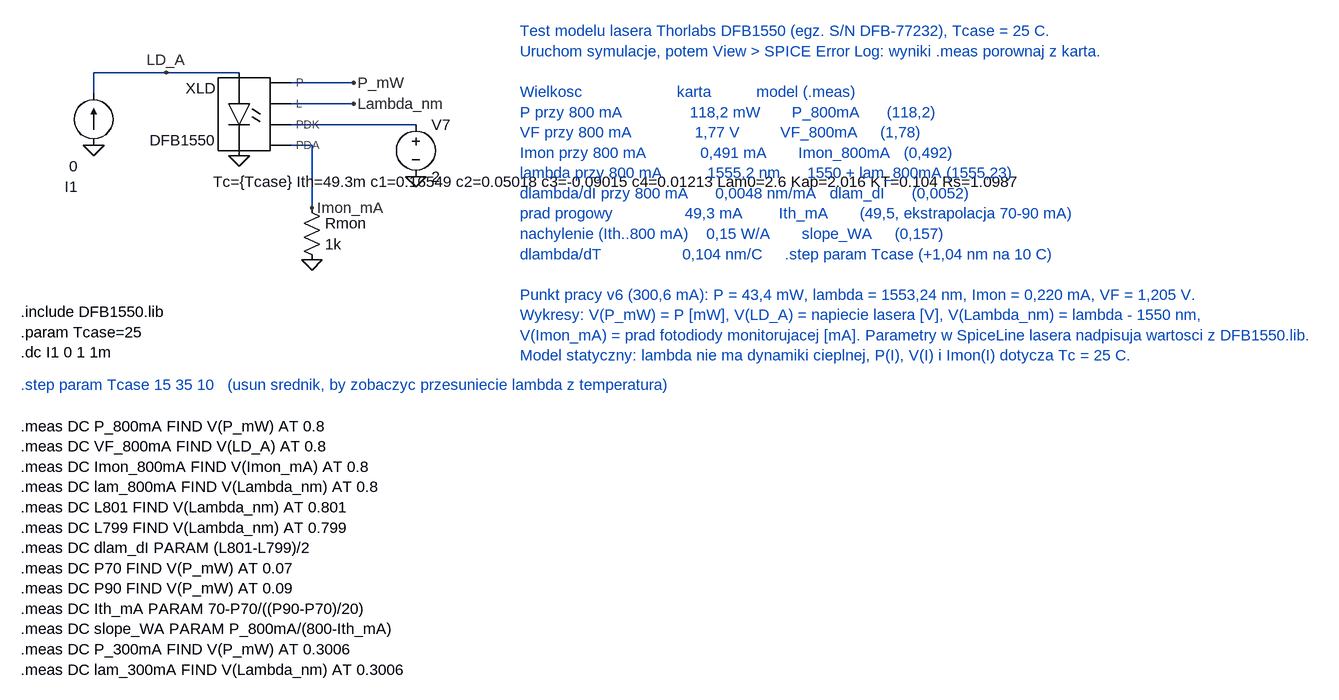
[diagram p0: schematic DFB1550_test.asc]
DFB1550_test.asc, the LTspice schematic file:
Version 4
SHEET 1 1600 1100
WIRE 176 192 176 160
WIRE 176 160 400 160
WIRE 480 176 576 176
WIRE 480 208 576 208
WIRE 480 240 672 240
WIRE 480 272 512 272
WIRE 512 272 512 368
FLAG 176 272 0
FLAG 288 160 LD_A
FLAG 400 288 0
FLAG 576 176 P_mW
FLAG 576 208 Lambda_nm
FLAG 672 320 0
FLAG 512 448 0
FLAG 512 368 Imon_mA
SYMBOL current 176 272 R180
WINDOW 0 24 -64 Left 2
WINDOW 3 24 -32 Left 2
SYMATTR InstName I1
SYMATTR Value 0
SYMBOL DFB1550 400 160 R0
WINDOW 0 -36 24 Right 2
WINDOW 3 -36 104 Right 2
WINDOW 39 -40 168 Left 2
SYMATTR InstName XLD
SYMATTR Value DFB1550
SYMATTR SpiceLine Tc={Tcase} Ith=49.3m c1=0.16549 c2=0.05018 c3=-0.09015 c4=0.01213 Lam0=2.6 Kap=2.016 KT=0.104 Rs=1.0987
SYMBOL voltage 672 224 R0
WINDOW 0 24 16 Left 2
WINDOW 3 24 96 Left 2
SYMATTR InstName V7
SYMATTR Value 2
SYMBOL res 496 352 R0
WINDOW 0 36 40 Left 2
WINDOW 3 36 72 Left 2
SYMATTR InstName Rmon
SYMATTR Value 1k
TEXT 64 528 Left 2 !.include DFB1550.lib\n.param Tcase=25\n.dc I1 0 1 1m
TEXT 64 640 Left 2 ;.step param Tcase 15 35 10   (usun srednik, by zobaczyc przesuniecie lambda z temperatura)
TEXT 64 704 Left 2 !.meas DC P_800mA FIND V(P_mW) AT 0.8\n.meas DC VF_800mA FIND V(LD_A) AT 0.8\n.meas DC Imon_800mA FIND V(Imon_mA) AT 0.8\n.meas DC lam_800mA FIND V(Lambda_nm) AT 0.8\n.meas DC L801 FIND V(Lambda_nm) AT 0.801\n.meas DC L799 FIND V(Lambda_nm) AT 0.799\n.meas DC dlam_dI PARAM (L801-L799)/2\n.meas DC P70 FIND V(P_mW) AT 0.07\n.meas DC P90 FIND V(P_mW) AT 0.09\n.meas DC Ith_mA PARAM 70-P70/((P90-P70)/20)\n.meas DC slope_WA PARAM P_800mA/(800-Ith_mA)\n.meas DC P_300mA FIND V(P_mW) AT 0.3006\n.meas DC lam_300mA FIND V(Lambda_nm) AT 0.3006
TEXT 832 96 Left 2 ;Test modelu lasera Thorlabs DFB1550 (egz. S/N DFB-77232), Tcase = 25 C.\nUruchom symulacje, potem View > SPICE Error Log: wyniki .meas porownaj z karta.\n\nWielkosc                     karta          model (.meas)\nP przy 800 mA               118,2 mW       P_800mA      (118,2)\nVF przy 800 mA              1,77 V         VF_800mA     (1,78)\nImon przy 800 mA            0,491 mA       Imon_800mA   (0,492)\nlambda przy 800 mA          1555,2 nm      1550 + lam_800mA (1555,23)\ndlambda/dI przy 800 mA      0,0048 nm/mA   dlam_dI      (0,0052)\nprad progowy                49,3 mA        Ith_mA       (49,5, ekstrapolacja 70-90 mA)\nnachylenie (Ith..800 mA)    0,15 W/A       slope_WA     (0,157)\ndlambda/dT                  0,104 nm/C     .step param Tcase (+1,04 nm na 10 C)\n\nPunkt pracy v6 (300,6 mA): P = 43,4 mW, lambda = 1553,24 nm, Imon = 0,220 mA, VF = 1,205 V.\nWykresy: V(P_mW) = P [mW], V(LD_A) = napiecie lasera [V], V(Lambda_nm) = lambda - 1550 nm,\nV(Imon_mA) = prad fotodiody monitorujacej [mA]. Parametry w SpiceLine lasera nadpisuja wartosci z DFB1550.lib.\nModel statyczny: lambda nie ma dynamiki cieplnej, P(I), V(I) i Imon(I) dotycza Tc = 25 C.

The netlist it stands for:
* DFB1550_test.asc
I1 0 LD_A 0
XXLD LD_A 0 P_mW Lambda_nm N001 Imon_mA DFB1550 Tc={Tcase} Ith=49.3m c1=0.16549 c2=0.05018 c3=-0.09015 c4=0.01213 Lam0=2.6 Kap=2.016 KT=0.104 Rs=1.0987  ; pins A K P L PDK PDA
V7 N001 0 2
Rmon Imon_mA 0 1k
.include DFB1550.lib
.param Tcase=25
.dc I1 0 1 1m
* .step param Tcase 15 35 10   (usun srednik, by zobaczyc przesuniecie lambda z temperatura)
.meas DC P_800mA FIND V(P_mW) AT 0.8
.meas DC VF_800mA FIND V(LD_A) AT 0.8
.meas DC Imon_800mA FIND V(Imon_mA) AT 0.8
.meas DC lam_800mA FIND V(Lambda_nm) AT 0.8
.meas DC L801 FIND V(Lambda_nm) AT 0.801
.meas DC L799 FIND V(Lambda_nm) AT 0.799
.meas DC dlam_dI PARAM (L801-L799)/2
.meas DC P70 FIND V(P_mW) AT 0.07
.meas DC P90 FIND V(P_mW) AT 0.09
.meas DC Ith_mA PARAM 70-P70/((P90-P70)/20)
.meas DC slope_WA PARAM P_800mA/(800-Ith_mA)
.meas DC P_300mA FIND V(P_mW) AT 0.3006
.meas DC lam_300mA FIND V(Lambda_nm) AT 0.3006
* Test modelu lasera Thorlabs DFB1550 (egz. S/N DFB-77232), Tcase = 25 C.
* Uruchom symulacje, potem View > SPICE Error Log: wyniki .meas porownaj z karta.
* Wielkosc                     karta          model (.meas)
* P przy 800 mA               118,2 mW       P_800mA      (118,2)
* VF przy 800 mA              1,77 V         VF_800mA     (1,78)
* Imon przy 800 mA            0,491 mA       Imon_800mA   (0,492)
* lambda przy 800 mA          1555,2 nm      1550 + lam_800mA (1555,23)
* dlambda/dI przy 800 mA      0,0048 nm/mA   dlam_dI      (0,0052)
* prad progowy                49,3 mA        Ith_mA       (49,5, ekstrapolacja 70-90 mA)
* nachylenie (Ith..800 mA)    0,15 W/A       slope_WA     (0,157)
* dlambda/dT                  0,104 nm/C     .step param Tcase (+1,04 nm na 10 C)
* Punkt pracy v6 (300,6 mA): P = 43,4 mW, lambda = 1553,24 nm, Imon = 0,220 mA, VF = 1,205 V.
* Wykresy: V(P_mW) = P [mW], V(LD_A) = napiecie lasera [V], V(Lambda_nm) = lambda - 1550 nm,
* V(Imon_mA) = prad fotodiody monitorujacej [mA]. Parametry w SpiceLine lasera nadpisuja wartosci z DFB1550.lib.
* Model statyczny: lambda nie ma dynamiki cieplnej, P(I), V(I) i Imon(I) dotycza Tc = 25 C.
.backanno
.end